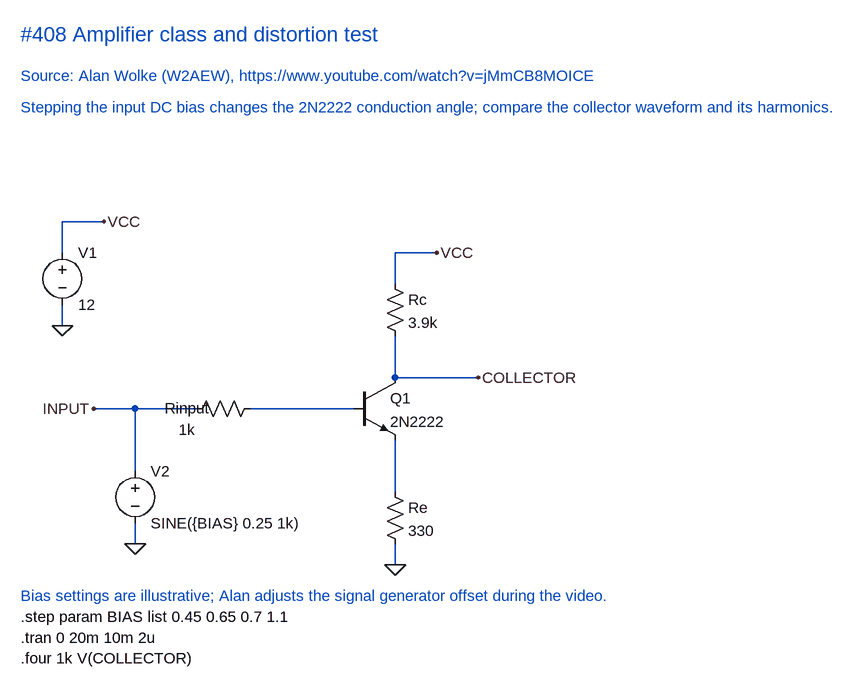
[diagram p0: schematic Amplifier class distortion.asc]
Amplifier class distortion.asc, the LTspice schematic file:
Version 4.1
SHEET 1 1056 1056
WIRE 96 368 96 320
WIRE 96 320 160 320
WIRE 96 480 96 448
WIRE 608 416 608 368
WIRE 608 368 672 368
WIRE 608 560 608 496
WIRE 736 560 608 560
WIRE 208 608 208 704
WIRE 208 608 144 608
WIRE 304 608 208 608
WIRE 544 608 384 608
WIRE 608 736 608 656
WIRE 608 848 608 816
WIRE 208 816 208 784
FLAG 160 320 VCC
FLAG 96 480 0
FLAG 672 368 VCC
FLAG 736 560 COLLECTOR
FLAG 208 816 0
FLAG 608 848 0
FLAG 144 608 INPUT
SYMBOL voltage 96 352 R0
SYMATTR InstName V1
SYMATTR Value 12
SYMBOL voltage 208 688 R0
SYMATTR InstName V2
SYMATTR Value SINE({BIAS} 0.25 1k)
SYMBOL res 592 400 R0
SYMATTR InstName Rc
SYMATTR Value 3.9k
SYMBOL res 288 624 R270
WINDOW 0 32 0 VBottom 2
WINDOW 3 -32 0 VTop 2
SYMATTR InstName Rinput
SYMATTR Value 1k
SYMBOL npn 544 560 R0
SYMATTR InstName Q1
SYMATTR Value 2N2222
SYMBOL res 592 720 R0
SYMATTR InstName Re
SYMATTR Value 330
TEXT 32 32 Left 3 ;#408 Amplifier class and distortion test
TEXT 32 96 Left 2 ;Source: Alan Wolke (W2AEW), https://www.youtube.com/watch?v=jMmCB8MOICE
TEXT 32 144 Left 2 ;Stepping the input DC bias changes the 2N2222 conduction angle; compare the collector waveform and its harmonics.
TEXT 32 896 Left 2 ;Bias settings are illustrative; Alan adjusts the signal generator offset during the video.
TEXT 32 928 Left 2 !.step param BIAS list 0.45 0.65 0.7 1.1
TEXT 32 960 Left 2 !.tran 0 20m 10m 2u
TEXT 32 992 Left 2 !.four 1k V(COLLECTOR)

The netlist it stands for:
* Amplifier class distortion.asc
V1 VCC 0 12
V2 INPUT 0 SINE({BIAS} 0.25 1k)
Rc VCC COLLECTOR 3.9k
Rinput INPUT N001 1k
Q1 COLLECTOR N001 N002 0 2N2222
Re N002 0 330
.model NPN NPN
.model PNP PNP
.lib standard.bjt
* #408 Amplifier class and distortion test
* Source: Alan Wolke (W2AEW), https://www.youtube.com/watch?v=jMmCB8MOICE
* Stepping the input DC bias changes the 2N2222 conduction angle; compare the collector waveform and its harmonics.
* Bias settings are illustrative; Alan adjusts the signal generator offset during the video.
.step param BIAS list 0.45 0.65 0.7 1.1
.tran 0 20m 10m 2u
.four 1k V(COLLECTOR)
.backanno
.end